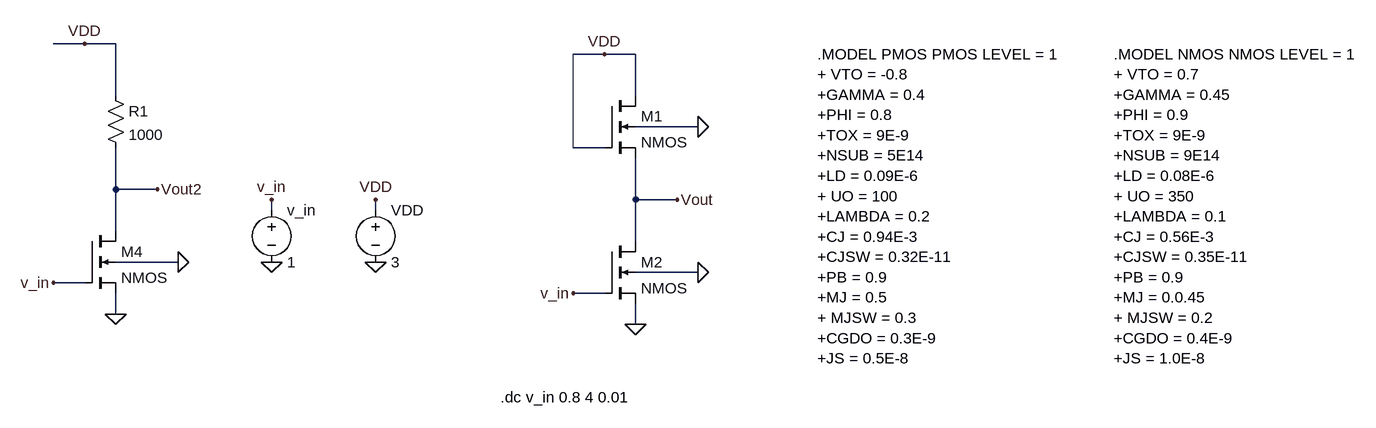
[diagram p0: schematic Lab4.asc]
Lab4.asc, the LTspice schematic file:
Version 4
SHEET 1 1512 688
WIRE -416 128 -464 128
WIRE -368 128 -416 128
WIRE 384 144 336 144
WIRE 432 144 384 144
WIRE -368 208 -368 128
WIRE 432 208 432 144
WIRE 528 256 432 256
WIRE 336 288 336 144
WIRE 384 288 336 288
WIRE -368 352 -368 288
WIRE -304 352 -368 352
WIRE 432 368 432 304
WIRE 496 368 432 368
WIRE -128 384 -128 368
WIRE 32 384 32 368
WIRE -368 416 -368 352
WIRE 432 432 432 368
WIRE -272 464 -368 464
WIRE 528 480 432 480
WIRE -416 496 -464 496
WIRE 384 512 336 512
WIRE -368 544 -368 512
WIRE 432 560 432 528
FLAG 32 464 0
FLAG 32 368 VDD
FLAG 384 144 VDD
FLAG 432 560 0
FLAG -128 464 0
FLAG -128 368 v_in
FLAG 336 512 v_in
FLAG 528 256 0
FLAG 528 480 0
FLAG 496 368 Vout
FLAG -416 128 VDD
FLAG -368 544 0
FLAG -464 496 v_in
FLAG -272 464 0
FLAG -304 352 Vout2
SYMBOL nmos4 384 208 R0
SYMATTR InstName M1
SYMATTR Value2 l=2u w=2u
SYMBOL nmos4 384 432 R0
SYMATTR InstName M2
SYMATTR Value2 l=2u w=20u
SYMBOL Voltage 32 368 R0
SYMATTR InstName VDD
SYMATTR Value 3
SYMBOL Voltage -128 368 R0
SYMATTR InstName v_in
SYMATTR Value 1
SYMBOL nmos4 -416 416 R0
SYMATTR InstName M4
SYMATTR Value2 l=2u w=20u
SYMBOL Res -384 192 R0
SYMATTR InstName R1
SYMATTR Value 1000
TEXT 712 144 Left 2 !.MODEL PMOS PMOS LEVEL = 1\n+ VTO = -0.8\n+GAMMA = 0.4\n+PHI = 0.8\n+TOX = 9E-9\n+NSUB = 5E14\n+LD = 0.09E-6\n+ UO = 100\n+LAMBDA = 0.2\n+CJ = 0.94E-3\n+CJSW = 0.32E-11\n+PB = 0.9\n+MJ = 0.5\n+ MJSW = 0.3\n+CGDO = 0.3E-9\n+JS = 0.5E-8
TEXT 1168 144 Left 2 !.MODEL NMOS NMOS LEVEL = 1\n+ VTO = 0.7\n+GAMMA = 0.45\n+PHI = 0.9\n+TOX = 9E-9\n+NSUB = 9E14\n+LD = 0.08E-6\n+ UO = 350\n+LAMBDA = 0.1\n+CJ = 0.56E-3\n+CJSW = 0.35E-11\n+PB = 0.9\n+MJ = 0.0.45\n+ MJSW = 0.2\n+CGDO = 0.4E-9\n+JS = 1.0E-8
TEXT 224 672 Left 2 !.dc v_in 0.8 4 0.01

The netlist it stands for:
* Lab4.asc
M1 VDD VDD Vout 0 NMOS l=2u w=2u
M2 Vout v_in 0 0 NMOS l=2u w=20u
VDD VDD 0 3
v_in v_in 0 1
M4 Vout2 v_in 0 0 NMOS l=2u w=20u
R1 VDD Vout2 1000
.model NMOS NMOS
.model PMOS PMOS
.lib standard.mos
.MODEL PMOS PMOS LEVEL = 1
+ VTO = -0.8
+GAMMA = 0.4
+PHI = 0.8
+TOX = 9E-9
+NSUB = 5E14
+LD = 0.09E-6
+ UO = 100
+LAMBDA = 0.2
+CJ = 0.94E-3
+CJSW = 0.32E-11
+PB = 0.9
+MJ = 0.5
+ MJSW = 0.3
+CGDO = 0.3E-9
+JS = 0.5E-8
.MODEL NMOS NMOS LEVEL = 1
+ VTO = 0.7
+GAMMA = 0.45
+PHI = 0.9
+TOX = 9E-9
+NSUB = 9E14
+LD = 0.08E-6
+ UO = 350
+LAMBDA = 0.1
+CJ = 0.56E-3
+CJSW = 0.35E-11
+PB = 0.9
+MJ = 0.0.45
+ MJSW = 0.2
+CGDO = 0.4E-9
+JS = 1.0E-8
.dc v_in 0.8 4 0.01
.backanno
.end